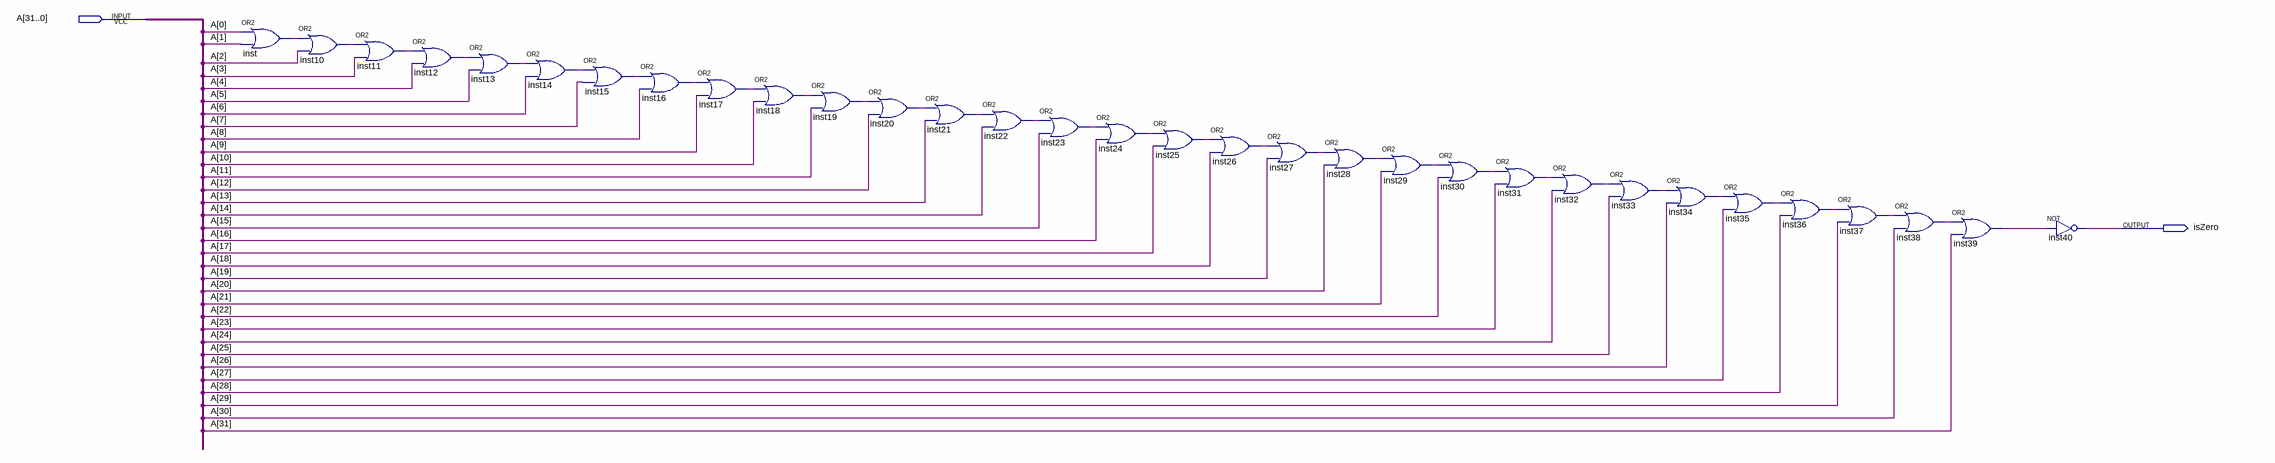
[diagram p0: schematic sheet]
// Quartus schematic isZero.bdf as structural Verilog: 32 symbols, 2 pins
module isZero (
  input  [31:0] A,
  output isZero
);

  wire inst10_out, inst11_out, inst12_out, inst13_out, inst14_out, inst15_out, inst16_out, inst17_out,
       inst18_out, inst19_out, inst20_out, inst21_out, inst22_out, inst23_out, inst24_out, inst25_out,
       inst26_out, inst27_out, inst28_out, inst29_out, inst30_out, inst31_out, inst32_out, inst33_out,
       inst34_out, inst35_out, inst36_out, inst37_out, inst38_out, inst39_out, inst_out;

  or inst (inst_out, A[0], A[1]);
  or inst10 (inst10_out, inst_out, A[2]);
  or inst11 (inst11_out, inst10_out, A[3]);
  or inst12 (inst12_out, inst11_out, A[4]);
  or inst13 (inst13_out, inst12_out, A[5]);
  or inst14 (inst14_out, inst13_out, A[6]);
  or inst15 (inst15_out, inst14_out, A[7]);
  or inst16 (inst16_out, inst15_out, A[8]);
  or inst17 (inst17_out, inst16_out, A[9]);
  or inst18 (inst18_out, inst17_out, A[10]);
  or inst19 (inst19_out, inst18_out, A[11]);
  or inst20 (inst20_out, inst19_out, A[12]);
  or inst21 (inst21_out, inst20_out, A[13]);
  or inst22 (inst22_out, inst21_out, A[14]);
  or inst23 (inst23_out, inst22_out, A[15]);
  or inst24 (inst24_out, inst23_out, A[16]);
  or inst25 (inst25_out, inst24_out, A[17]);
  or inst26 (inst26_out, inst25_out, A[18]);
  or inst27 (inst27_out, inst26_out, A[19]);
  or inst28 (inst28_out, inst27_out, A[20]);
  or inst29 (inst29_out, inst28_out, A[21]);
  or inst30 (inst30_out, inst29_out, A[22]);
  or inst31 (inst31_out, inst30_out, A[23]);
  or inst32 (inst32_out, inst31_out, A[24]);
  or inst33 (inst33_out, inst32_out, A[25]);
  or inst34 (inst34_out, inst33_out, A[26]);
  or inst35 (inst35_out, inst34_out, A[27]);
  or inst36 (inst36_out, inst35_out, A[28]);
  or inst37 (inst37_out, inst36_out, A[29]);
  or inst38 (inst38_out, inst37_out, A[30]);
  or inst39 (inst39_out, inst38_out, A[31]);
  not inst40 (isZero, inst39_out);
endmodule
